# Altium schematic sheet Connector_FMU.SchDoc
size A4; SheetNumber: 5; SheetTotal: 5
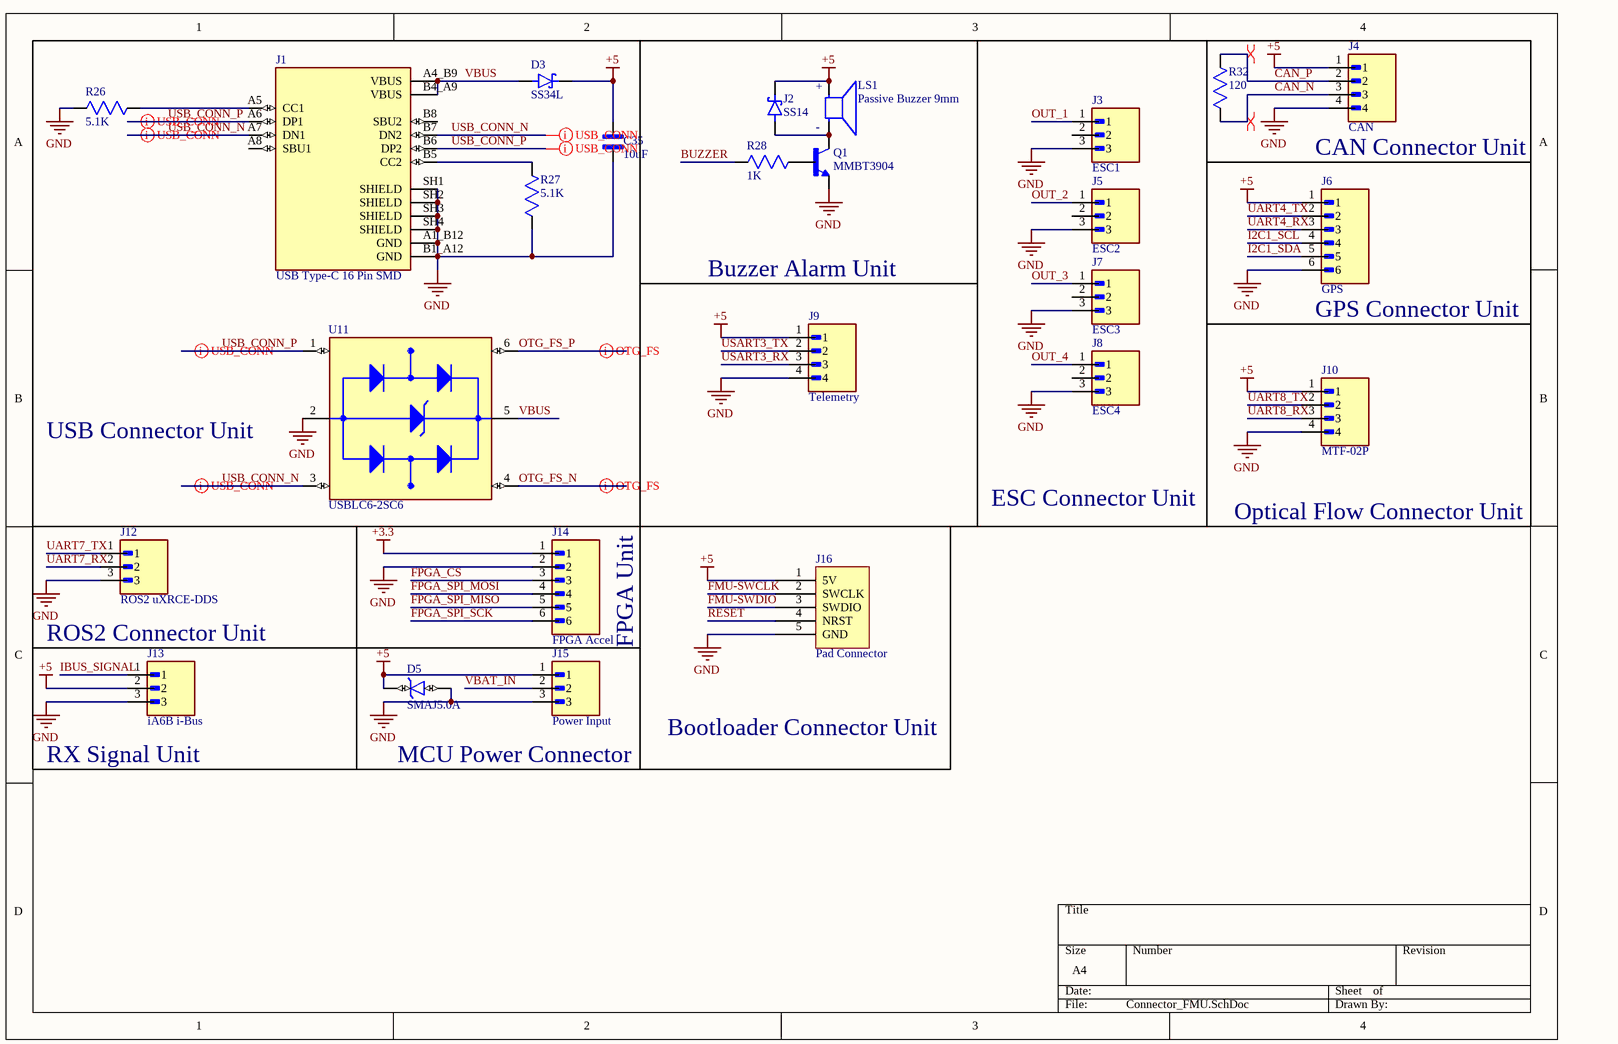
[diagram p0: Connector_FMU.SchDoc]

## Parts
C35  10uF  [CAPC2012X135N]
D3  SS34L  [SODFL3618X143N]
D5  SMAJ5.0A  [DIOM5026X229N]
J1  USB Type-C 16 Pin SMD  [AMPHENOL_10155435-00011LF]
J2  SS14  [SMA]
J3  ESC1  [JST_S3B-XH-SM4-TB]
J4  CAN  [JST_S4B-XH-SM4-TB]
J5  ESC2  [JST_S3B-XH-SM4-TB]
J6  GPS  [JST_S6B-XH-SM4-TB]
J7  ESC3  [JST_S3B-XH-SM4-TB]
J8  ESC4  [JST_S3B-XH-SM4-TB]
J9  Telemetry  [JST_S4B-XH-SM4-TB]
J10  MTF-02P  [JST_S4B-XH-SM4-TB]
J12  ROS2 uXRCE-DDS  [JST_S3B-XH-SM4-TB]
J13  iA6B i-Bus  [JST_S3B-XH-SM4-TB]
J14  FPGA Accel  [JST_S6B-XH-SM4-TB]
J15  Power Input  [JST_S3B-XH-SM4-TB]
J16  Pad Connector  [Pad Connector PCB]
LS1  Passive Buzzer 9mm  [XDCR_AT-0927-TT-2-R]
Q1  MMBT3904  [TRANS_MMBT3904]
R26  5.1K  [RESC2013X65N]
R27  5.1K  [RESC2013X65N]
R28  1K  [RESC2013X65N]
R32  120  [RESC2013X65N]
U11  USBLC6-2SC6  [SOT95P280X145-6N]

## Blocks framed on the sheet
USB Connector Unit: C35 D3 J1 R26 R27 U11
Buzzer Alarm Unit: J2 LS1 Q1 R28
ESC Connector Unit: J3 J5 J7 J8
CAN Connector Unit: J4 R32
Optical Flow Connector Unit: J10
GPS Connector Unit: J6
ROS2 Connector Unit: J12
RX Signal Unit: J13

## Nets
+3.3: J14.1
+5: C35.2 D3.C(K) D5.1(K) J2.P2(C) J4.1 J6.1 J9.1 J10.1 J13.2 J15.1 J16.1(5V) LS1.P
GND: C35.1 D5.2(A) J1.A1_B12(GND) J1.B1_A12(GND) J1.SH1(SHIELD) J1.SH2(SHIELD) J1.SH3(SHIELD) J1.SH4(SHIELD) J3.3 J4.4 J5.3 J6.6 J7.3 J8.3 J9.4 J10.4 J12.3 J13.3 J14.2 J15.3 J16.5(GND) Q1.2(E) R26.1(R1) R27.1(R1) U11.2(GND)
BUZZER: R28.2(R2)
CAN_N: J4.3 R32.2(R2)
CAN_P: J4.2 R32.1(R1)
FMU-SWCLK: J16.2(SWCLK)
FMU-SWDIO: J16.3(SWDIO)
FPGA_CS: J14.3
FPGA_SPI_MISO: J14.5
FPGA_SPI_MOSI: J14.4
FPGA_SPI_SCK: J14.6
I2C1_SCL: J6.4
I2C1_SDA: J6.5
IBUS_SIGNAL: J13.1
OTG_FS_N: U11.4(I/O2_OUT)
OTG_FS_P: U11.6(I/O1_OUT)
OUT_1: J3.1
OUT_2: J5.1
OUT_3: J7.1
OUT_4: J8.1
RESET: J16.4(NRST)
UART4_RX: J6.3
UART4_TX: J6.2
UART7_RX: J12.2
UART7_TX: J12.1
UART8_RX: J10.3
UART8_TX: J10.2
USART3_RX: J9.3
USART3_TX: J9.2
USB_CONN_N: J1.A7(DN1) J1.B7(DN2) U11.3(I/O2_IN)
USB_CONN_P: J1.A6(DP1) J1.B6(DP2) U11.1(I/O1_IN)
VBAT_IN: J15.2
VBUS: D3.A J1.A4_B9(VBUS) J1.B4_A9(VBUS) U11.5(VBUS)
NetJ1_A5: J1.A5(CC1) R26.2(R2)
NetJ1_B5: J1.B5(CC2) R27.2(R2)
NetJ2_P1: J2.P1(A) LS1.N Q1.3(C)
NetQ1_1: Q1.1(B) R28.1(R1)

Not connected (* = marked no-connect by the designer): J1 A8(SBU1) B8(SBU2); J3 2; J5 2; J7 2; J8 2

## Layout directives
differential pair: CAN_N, CAN_P, OTG_FS_N, OTG_FS_P, USB_CONN_N, USB_CONN_P

## Notes on the sheet
- FPGA Unit
- MCU Power Connector
- Bootloader Connector Unit
- (in symbol AT-0927-TT-2-R) +; -

## Library data of the parts
C35 = GRM21BR61C106KE15L: 10 ÂµF Â±10% 16V Ceramic Capacitor X5R 0805 (2012 Metric); MF: Murata; SnapEDA_Link: https://www.snapeda.com/parts/GRM21BR61C106KE15L/Murata/view-part/?ref=snap; Package: 805-2 Murata; Value: *; MP: GRM21BR61C106KE15L; Check_prices: https://www.snapeda.com/parts/GRM21BR61C106KE15L/Murata/view-part/?ref=eda
D3 = SS34L: 3A, 40V, Planar Schottky; MF: Taiwan Semiconductor; SnapEDA_Link: https://www.snapeda.com/parts/SS34L/taiwan/view-part/?ref=snap; Package: SUB SMA-2 Taiwan Semiconductor; Value: *; MP: SS34L; Check_prices: https://www.snapeda.com/parts/SS34L/taiwan/view-part/?ref=eda
D5 = SMAJ5.0A: A 5.0V, 400W, uni-directional, SMA pkg TVS Diode | Bourns SMAJ5.0A; SnapEDA_Link: https://www.snapeda.com/parts/SMAJ5.0A/Bourns/view-part/?ref=snap; Package: DO-214 Bourns; Value: *; MF: Bourns; MP: SMAJ5.0A; Check_prices: https://www.snapeda.com/parts/SMAJ5.0A/Bourns/view-part/?ref=eda
J1 = 10155435-00011LF: Package: None; Price: None; Value: *; MP: 10155435-00011LF; Availability: Unavailable
J2 = SS14: Diode Schottky 40 V 1A Surface Mount DO-214AC (SMA); MF: onsemi; SnapEDA_Link: https://www.snapeda.com/parts/SS14/Onsemi/view-part/?ref=snap; Package: SMA-2 ON Semiconductor; Value: *; MP: SS14; Check_prices: https://www.snapeda.com/parts/SS14/Onsemi/view-part/?ref=eda
J3 J5 J7 J8 J12 J13 J15 = S3B-XH-SM3-TB: Connector Header Surface Mount, Right Angle 4 position 0.098 (2.50mm); MF: JST Sales; MP: S4B/XH/SM4/TB; SnapEDA_Link: https://www.snapeda.com/parts/S4B/XH/SM4/TB/JST/view-part/?ref=snap; Package: None; Value: *; Check_prices: https://www.snapeda.com/parts/S4B/XH/SM4/TB/JST/view-part/?ref=eda
J4 J9 J10 = S4B-XH-SM4-TB: Connector Header Surface Mount, Right Angle 4 position 0.098 (2.50mm); MF: JST Sales; MP: S4B/XH/SM4/TB; SnapEDA_Link: https://www.snapeda.com/parts/S4B/XH/SM4/TB/JST/view-part/?ref=snap; Package: None; Value: *; Check_prices: https://www.snapeda.com/parts/S4B/XH/SM4/TB/JST/view-part/?ref=eda
J6 J14 = S6B-XH-SM4-TB: Connector Header Surface Mount, Right Angle 4 position 0.098 (2.50mm); MF: JST Sales; MP: S4B/XH/SM4/TB; SnapEDA_Link: https://www.snapeda.com/parts/S4B/XH/SM4/TB/JST/view-part/?ref=snap; Package: None; Value: *; Check_prices: https://www.snapeda.com/parts/S4B/XH/SM4/TB/JST/view-part/?ref=eda
LS1 = AT-0927-TT-2-R: AUDIO TRANSDUCER 3VP-P 70MA 20OHM 86DBA; MF: {'manufacturer': u'PUI Audio, Inc.'}; Package: None; Price: None; Value: *; MP: AT-0927-TT-2-R; Availability: Unavailable
Q1 = MMBT3904: BJT, SOT-23, 40V, 200mA, NPN, 0.35W, 150Â°C; MF: Diotec Semiconductor; SnapEDA_Link: https://www.snapeda.com/parts/MMBT3904/Diotec/view-part/?ref=snap; Package: SOT-23 Diotec; Value: *; MP: MMBT3904; Check_prices: https://www.snapeda.com/parts/MMBT3904/Diotec/view-part/?ref=eda
R26-R28 R32 = RC0805FR-075K1L: 5.1 kOhms Â±1% 0.125W, 1/8W Chip Resistor 0805 (2012 Metric) Moisture Resistant Thick Film; MF: Yageo; MP: RC0805FR075K1L; SnapEDA_Link: https://www.snapeda.com/parts/RC0805FR075K1L/Yageo/view-part/?ref=snap; Package: 0805-2 YAGEO; Value: *; Check_prices: https://www.snapeda.com/parts/RC0805FR075K1L/Yageo/view-part/?ref=eda
U11 = USBLC6-2SC6: 17V Clamp 5A (8/20Âµs) Ipp Tvs Diode Surface Mount SOT-23-6; MF: STMicroelectronics; Value: *; SnapEDA_Link: https://www.snapeda.com/parts/USBLC6-2SC6/STMicroelectronics/view-part/?ref=snap; Check_prices: https://www.snapeda.com/parts/USBLC6-2SC6/STMicroelectronics/view-part/?ref=eda; Purchase-URL: https://pricing.snapeda.com/search/part/USBLC6-2SC6/?ref=eda; Price: None; Availability: In Stock; Package: SOT-23-6 STMicroelectronics; MP: USBLC6-2SC6